# Altium schematic sheet Block Diagram.SchDoc
size 420 x 297 mm; DocumentNumber: 1; SheetNumber: 1
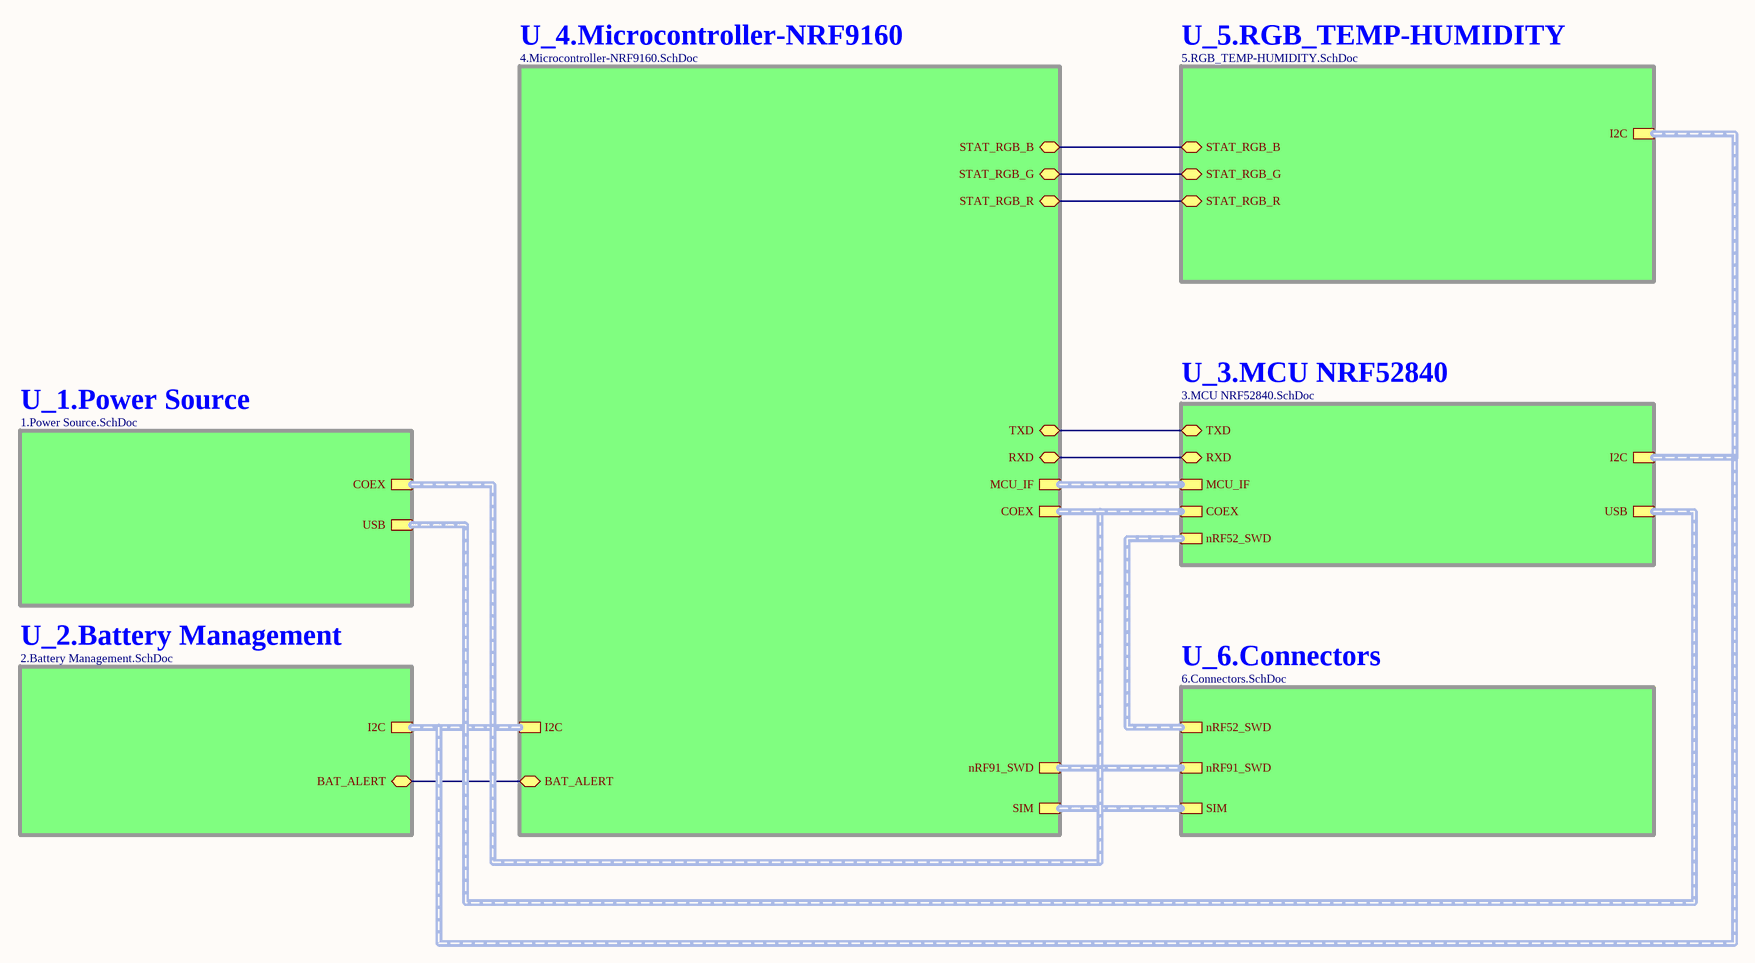
[diagram p0: Block Diagram.SchDoc]

## Sub-sheets
U_1.Power Source = 1.Power Source.SchDoc: USB (harness USB), COEX (harness COEX)
U_2.Battery Management = 2.Battery Management.SchDoc: I2C (harness I2C), BAT_ALERT (bidir)
U_3.MCU NRF52840 = 3.MCU NRF52840.SchDoc: COEX (harness COEX), nRF52_SWD (harness SWD), I2C (harness I2C), USB (harness USB), MCU_IF (harness MCU_IF), TXD (bidir), RXD (bidir)
U_4.Microcontroller-NRF9160 = 4.Microcontroller-NRF9160.SchDoc: nRF91_SWD (harness SWD), SIM (harness SIM), TXD (bidir), RXD (bidir), I2C (harness I2C), STAT_RGB_B (bidir), STAT_RGB_G (bidir), STAT_RGB_R (bidir), BAT_ALERT (bidir), MCU_IF (harness MCU_IF), COEX (harness COEX)
U_5.RGB_TEMP-HUMIDITY = 5.RGB_TEMP-HUMIDITY.SchDoc: I2C (harness I2C), STAT_RGB_B (bidir), STAT_RGB_G (bidir), STAT_RGB_R (bidir)
U_6.Connectors = 6.Connectors.SchDoc: SIM (harness SIM), nRF91_SWD (harness SWD), nRF52_SWD (harness SWD)

## Nets
(unnamed): sheet U_2.Battery Management/BAT_ALERT, sheet U_4.Microcontroller-NRF9160/BAT_ALERT
(unnamed): sheet U_3.MCU NRF52840/TXD, sheet U_4.Microcontroller-NRF9160/TXD
(unnamed): sheet U_3.MCU NRF52840/RXD, sheet U_4.Microcontroller-NRF9160/RXD
(unnamed): sheet U_5.RGB_TEMP-HUMIDITY/STAT_RGB_B, sheet U_4.Microcontroller-NRF9160/STAT_RGB_B
(unnamed): sheet U_5.RGB_TEMP-HUMIDITY/STAT_RGB_G, sheet U_4.Microcontroller-NRF9160/STAT_RGB_G
(unnamed): sheet U_5.RGB_TEMP-HUMIDITY/STAT_RGB_R, sheet U_4.Microcontroller-NRF9160/STAT_RGB_R

## Buses and harness runs
harness sheet U_1.Power Source/COEX = sheet U_3.MCU NRF52840/COEX = sheet U_4.Microcontroller-NRF9160/COEX
harness sheet U_1.Power Source/USB = sheet U_3.MCU NRF52840/USB
harness sheet U_2.Battery Management/I2C = sheet U_3.MCU NRF52840/I2C = sheet U_4.Microcontroller-NRF9160/I2C = sheet U_5.RGB_TEMP-HUMIDITY/I2C
harness sheet U_3.MCU NRF52840/MCU_IF = sheet U_4.Microcontroller-NRF9160/MCU_IF
harness sheet U_3.MCU NRF52840/nRF52_SWD = sheet U_6.Connectors/nRF52_SWD
harness sheet U_4.Microcontroller-NRF9160/nRF91_SWD = sheet U_6.Connectors/nRF91_SWD
harness sheet U_4.Microcontroller-NRF9160/SIM = sheet U_6.Connectors/SIM

## Notes on the sheet
- ZyntelliTech
- File:
- Title:
- Date:
- Page
- Num:
- Total:
- Drawn By: Huzaifa Ali